# Altium schematic sheet 01_SBC_SCH.SchDoc
size A3; SheetNumber: 1; SheetTotal: 21
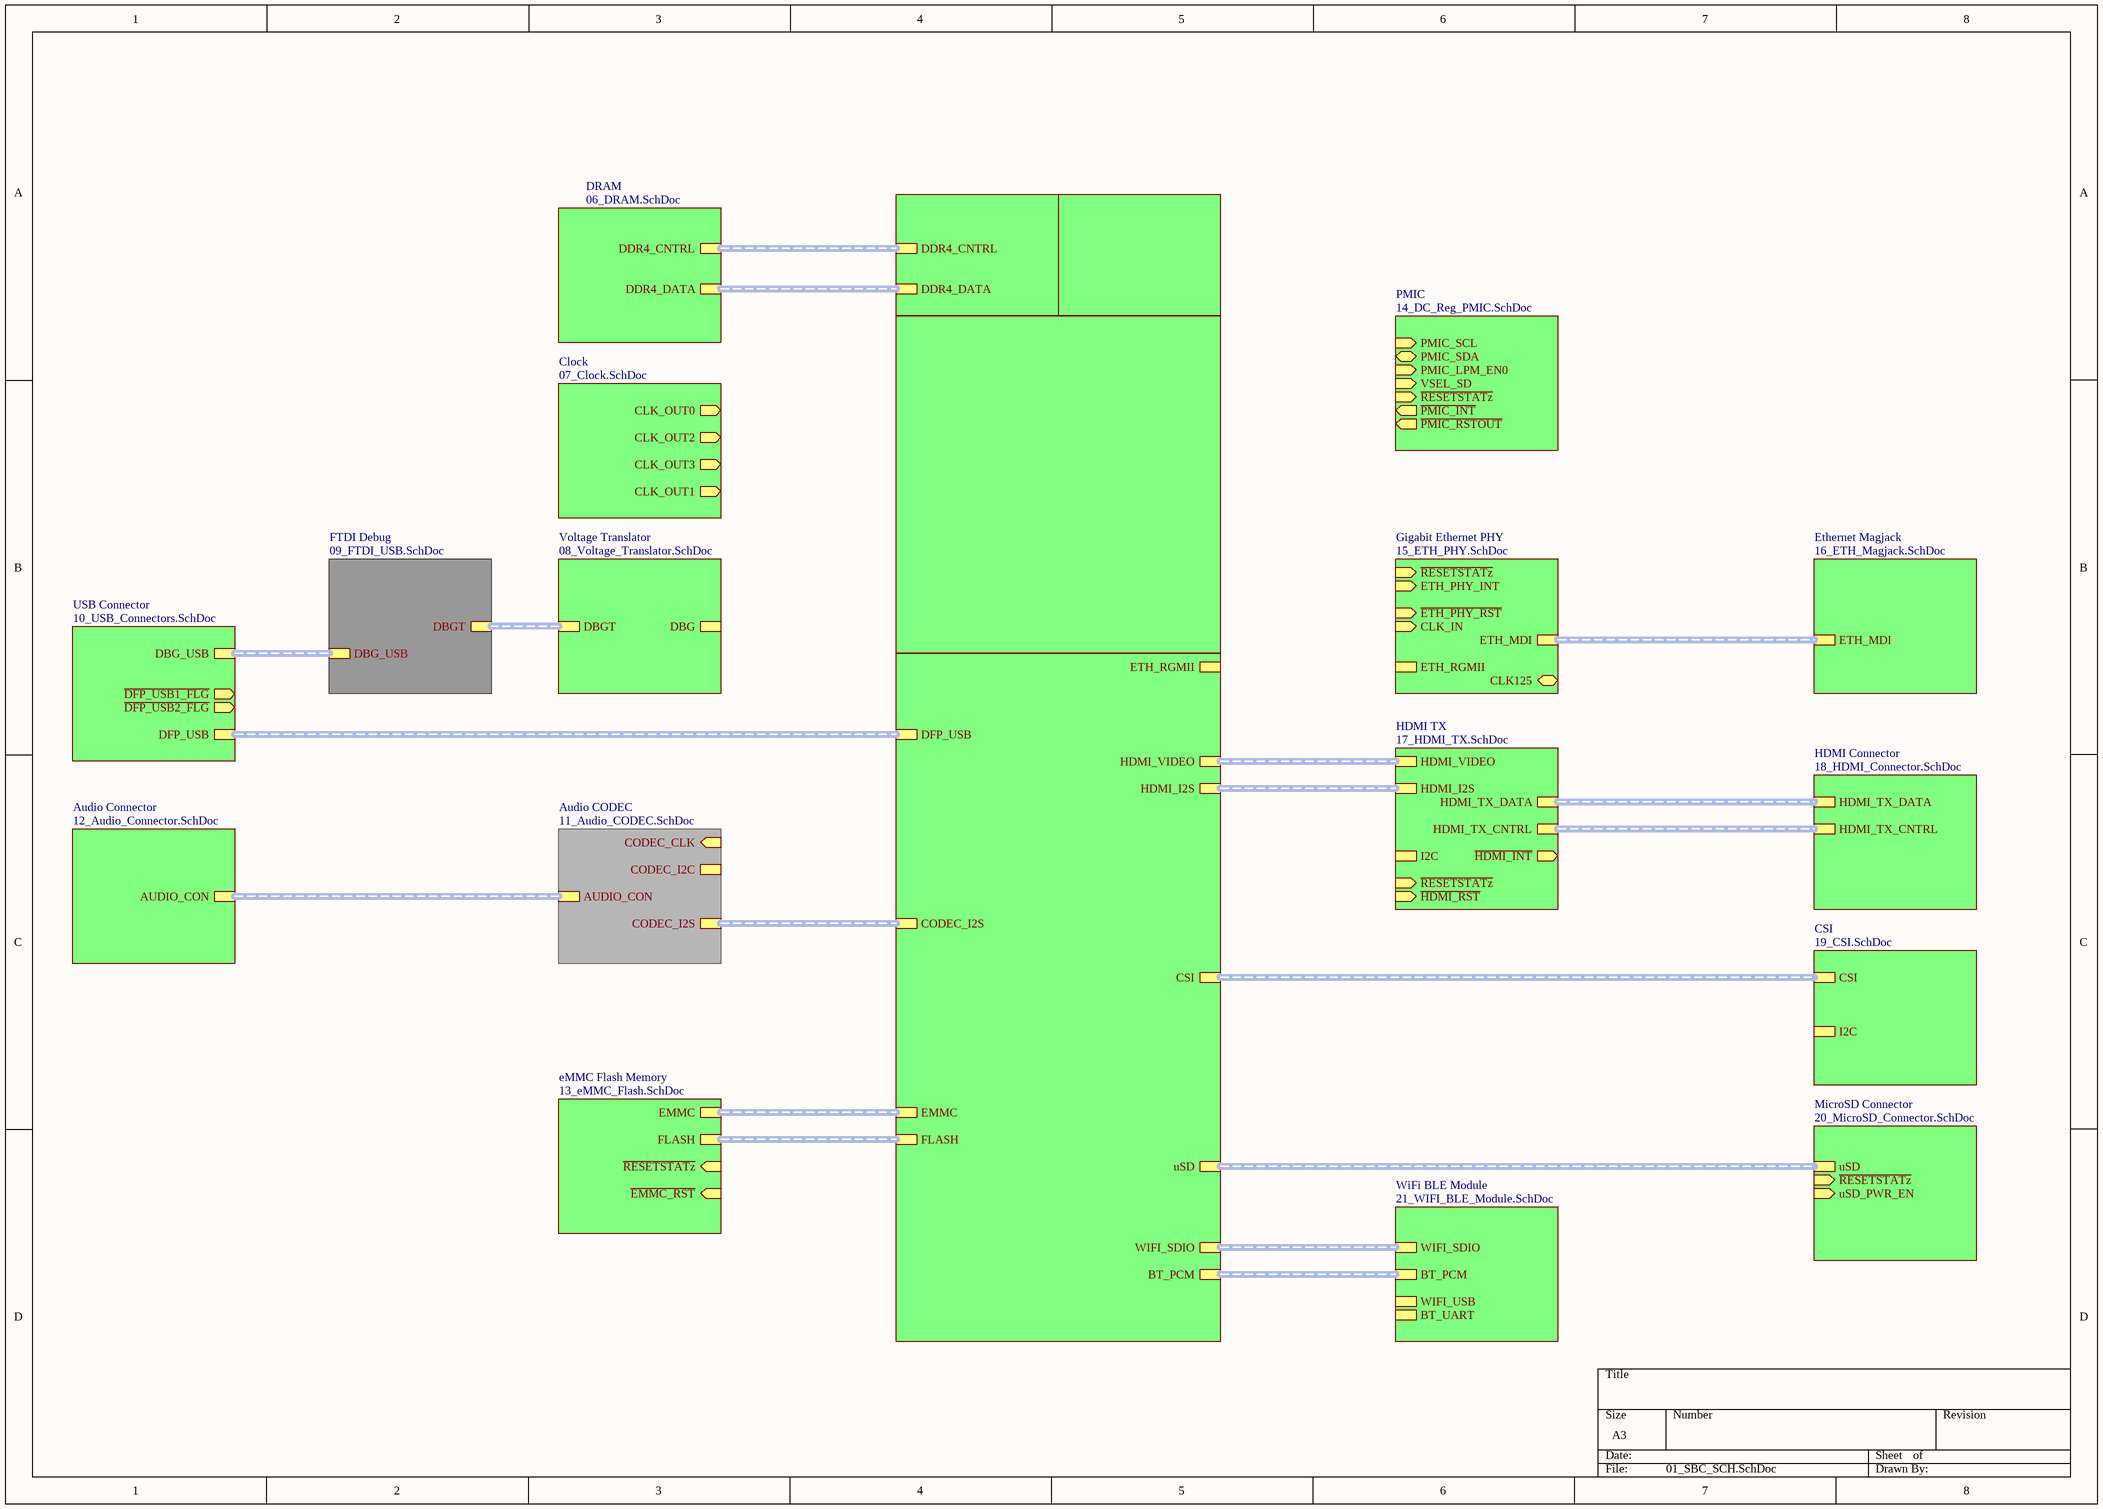
[diagram p0: 01_SBC_SCH.SchDoc]

## Sub-sheets
Audio CODEC = 11_Audio_CODEC.SchDoc: CODEC_I2S (harness CODEC_I2S), CODEC_I2C (harness CODEC_I2C), AUDIO_CON (harness AUDIO_CON), CODEC_CLK (in)
Audio Connector = 12_Audio_Connector.SchDoc: AUDIO_CON (harness AUDIO_CON)
Clock = 07_Clock.SchDoc: CLK_OUT0 (out), CLK_OUT1 (out), CLK_OUT2 (out), CLK_OUT3 (out)
CSI = 19_CSI.SchDoc: I2C (harness I2C), CSI (harness CSI)
DRAM = 06_DRAM.SchDoc: DDR4_CNTRL (harness DDR4_CNTRL), DDR4_DATA (harness DDR4_DATA)
eMMC Flash Memory = 13_eMMC_Flash.SchDoc: EMMC (harness EMMC), ~{RESETSTATz} (in), ~{EMMC_RST} (in), FLASH (harness FLASH)
Ethernet Magjack = 16_ETH_Magjack.SchDoc: ETH_MDI (harness ETH_MDI)
FTDI Debug = 09_FTDI_USB.SchDoc: DBGT (harness DBGT), DBG_USB (harness DBG_USB)
Gigabit Ethernet PHY = 15_ETH_PHY.SchDoc: CLK_IN (in), ETH_MDI (harness ETH_MDI), ETH_RGMII (harness ETH_RGMII), ETH_PHY_INT (in), ~{RESETSTATz} (in), ~{ETH_PHY_RST} (in), CLK125 (bidir)
HDMI Connector = 18_HDMI_Connector.SchDoc: HDMI_TX_DATA (harness HDMI_TX_DATA), HDMI_TX_CNTRL (harness HDMI_TX_CNTRL)
HDMI TX = 17_HDMI_TX.SchDoc: HDMI_VIDEO (harness HDMI_VIDEO), HDMI_I2S (harness HDMI_I2S), ~{RESETSTATz} (in), I2C (harness I2C), HDMI_TX_DATA (harness HDMI_TX_DATA), HDMI_TX_CNTRL (harness HDMI_TX_CNTRL), ~{HDMI_RST} (in), ~{HDMI_INT} (out)
MicroSD Connector = 20_MicroSD_Connector.SchDoc: uSD (harness uSD), ~{RESETSTATz} (in), uSD_PWR_EN (in)
PMIC = 14_DC_Reg_PMIC.SchDoc: PMIC_SCL (in), PMIC_SDA (bidir), PMIC_LPM_EN0 (in), VSEL_SD (in), ~{RESETSTATz} (in), ~{PMIC_INT} (out), ~{PMIC_RSTOUT} (out)
SoC Config & GPIOs = 04_SoC_CFG_GPIOs.SchDoc: no entries
SoC DRAM = 02_SoC_DRAM_DDR4.SchDoc: DDR4_CNTRL (harness DDR4_CNTRL), DDR4_DATA (harness DDR4_DATA)
SoC Interfaces = 05_SoC_Interfaces.SchDoc: EMMC (harness EMMC), WIFI_SDIO (harness WIFI_SDIO), uSD (harness uSD), FLASH (harness FLASH), BT_PCM (harness BT_PCM), CODEC_I2S (harness CODEC_I2S), ETH_RGMII (harness ETH_RGMII), HDMI_I2S (harness HDMI_I2S), HDMI_VIDEO (harness HDMI_VIDEO), CSI (harness CSI), DFP_USB (harness DFP_USB)
SoC Power = 03_SoC_Power.SchDoc: no entries
USB Connector = 10_USB_Connectors.SchDoc: DBG_USB (harness DBG_USB), DFP_USB (harness DFP_USB), ~{DFP_USB1_FLG} (out), ~{DFP_USB2_FLG} (out)
Voltage Translator = 08_Voltage_Translator.SchDoc: DBGT (harness DBGT), DBG (harness DBG)
WiFi BLE Module = 21_WIFI_BLE_Module.SchDoc: WIFI_SDIO (harness WIFI_SDIO), BT_UART (harness BT_UART), BT_PCM (harness BT_PCM), WIFI_USB (harness WIFI_USB)

## Buses and harness runs
harness sheet Audio CODEC/AUDIO_CON = sheet Audio Connector/AUDIO_CON
harness sheet Audio CODEC/CODEC_I2S = sheet SoC Interfaces/CODEC_I2S
harness sheet CSI/CSI = sheet SoC Interfaces/CSI
harness sheet DRAM/DDR4_CNTRL = sheet SoC DRAM/DDR4_CNTRL
harness sheet DRAM/DDR4_DATA = sheet SoC DRAM/DDR4_DATA
harness sheet eMMC Flash Memory/EMMC = sheet SoC Interfaces/EMMC
harness sheet eMMC Flash Memory/FLASH = sheet SoC Interfaces/FLASH
harness sheet Ethernet Magjack/ETH_MDI = sheet Gigabit Ethernet PHY/ETH_MDI
harness sheet FTDI Debug/DBG_USB = sheet USB Connector/DBG_USB
harness sheet FTDI Debug/DBGT = sheet Voltage Translator/DBGT
harness sheet HDMI Connector/HDMI_TX_CNTRL = sheet HDMI TX/HDMI_TX_CNTRL
harness sheet HDMI Connector/HDMI_TX_DATA = sheet HDMI TX/HDMI_TX_DATA
harness sheet HDMI TX/HDMI_I2S = sheet SoC Interfaces/HDMI_I2S
harness sheet HDMI TX/HDMI_VIDEO = sheet SoC Interfaces/HDMI_VIDEO
harness sheet MicroSD Connector/uSD = sheet SoC Interfaces/uSD
harness sheet SoC Interfaces/BT_PCM = sheet WiFi BLE Module/BT_PCM
harness sheet SoC Interfaces/DFP_USB = sheet USB Connector/DFP_USB
harness sheet SoC Interfaces/WIFI_SDIO = sheet WiFi BLE Module/WIFI_SDIO